# Altium schematic sheet Sheet1.SchDoc
size A4; SheetNumber: 1; SheetTotal: 1
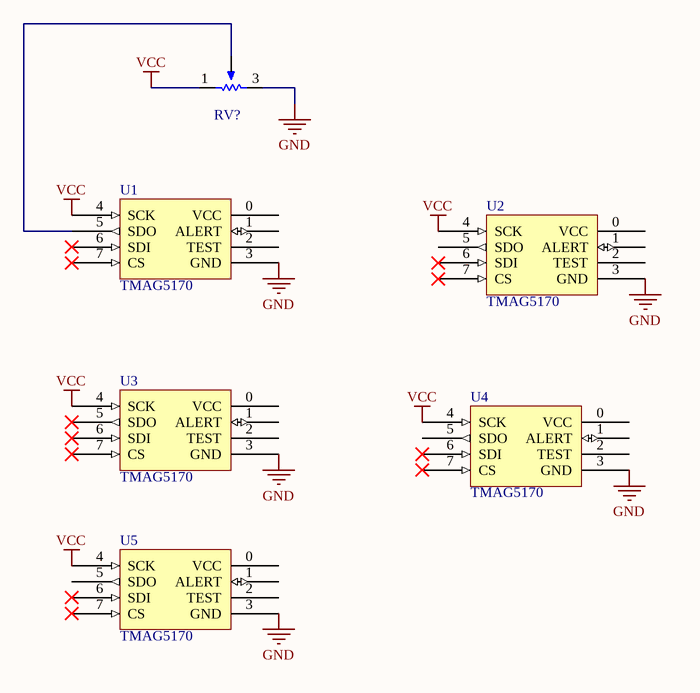
[diagram p0: Sheet1.SchDoc]

## Parts
RV?  RV20K  [RVAR10K]  (value not drawn)
U1  TMAG5170  [TMAG5170]
U2  TMAG5170  [TMAG5170]
U3  TMAG5170  [TMAG5170]
U4  TMAG5170  [TMAG5170]
U5  TMAG5170  [TMAG5170]

## Nets
GND: RV?.3 U1.3(GND) U2.3(GND) U3.3(GND) U4.3(GND) U5.3(GND)
VCC: RV?.1 U1.4(SCK) U2.4(SCK) U3.4(SCK) U4.4(SCK) U5.4(SCK)
NetRV?_2: RV?.2 U1.5(SDO)

Not connected (* = marked no-connect by the designer): U1 0(VCC) 1(ALERT) 2(TEST) 6(SDI)* 7(CS)*; U2 0(VCC) 1(ALERT) 2(TEST) 5(SDO) 6(SDI)* 7(CS)*; U3 0(VCC) 1(ALERT) 2(TEST) 5(SDO)* 6(SDI)* 7(CS)*; U4 0(VCC) 1(ALERT) 2(TEST) 5(SDO) 6(SDI)* 7(CS)*; U5 0(VCC) 1(ALERT) 2(TEST) 5(SDO) 6(SDI)* 7(CS)*

## Library data of the parts
RV? = Variable Resistor: Sim Note: Enter the Resistance value and the set point into parameter fields.; Set Position: 0.5; Published: 8-Jun-2000; LatestRevisionDate: 17-Jul-2002; LatestRevisionNote: Re-released for DXP Platform.; PackageReference: VR5; Publisher: Altium Limited